# Altium project BB-18 Control Board.PrjPcb (part 1 of 2)
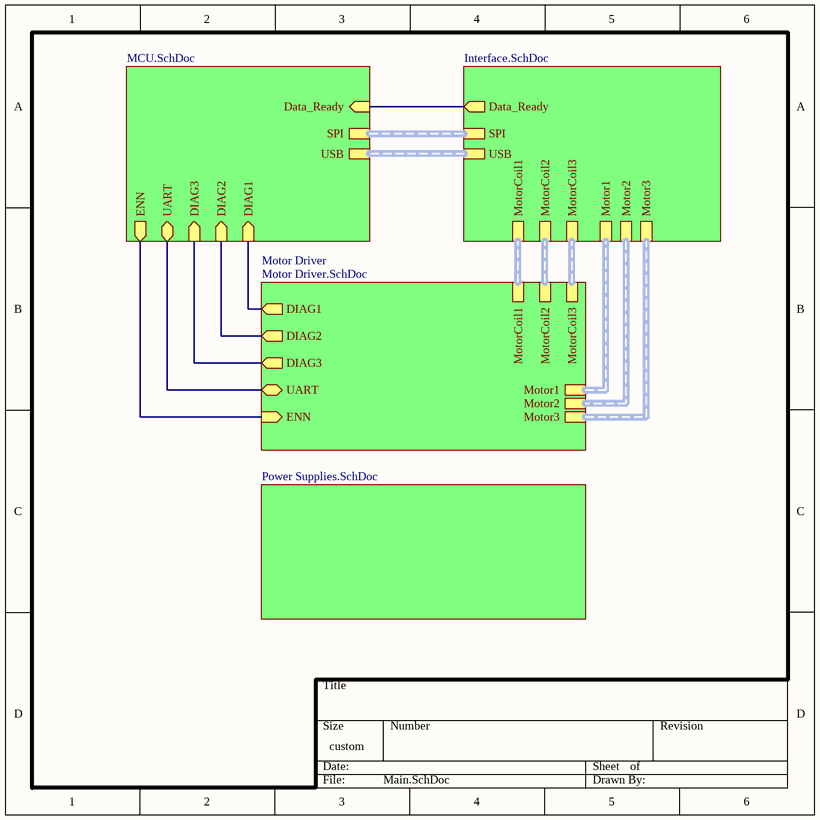
[diagram p0: Main.SchDoc]
5 sheets, 90 parts. Net scope: hierarchical (ports join the sheet entries above them; power ports are global).
Board file: BB-18 Control Board.PcbDoc
Sheets:
  Main.SchDoc
    MCU = MCU.SchDoc
    Interface = Interface.SchDoc
    Motor Driver = Motor Driver.SchDoc
    Power Supplies = Power Supplies.SchDoc

## Sheet Main.SchDoc
size 152 x 152 mm; SheetNumber: 1; SheetTotal: 5

### Sub-sheets
Interface = Interface.SchDoc: SPI (harness SPI), Data_Ready (out), MotorCoil3 (harness Motor3), MotorCoil2 (harness Motor2), MotorCoil1 (harness Motor1), Motor1 (harness Motor1), Motor2 (harness Motor2), Motor3 (harness Motor3), USB (harness USB)
MCU = MCU.SchDoc: SPI (harness SPI), Data_Ready (in), DIAG1 (in), DIAG2 (in), DIAG3 (in), UART (bidir), ENN (out), USB (harness USB)
Motor Driver = Motor Driver.SchDoc: MotorCoil3 (harness Motor3), MotorCoil2 (harness Motor2), MotorCoil1 (harness Motor1), Motor1 (harness Motor1), Motor2 (harness Motor2), Motor3 (harness Motor3), DIAG1 (out), DIAG2 (out), DIAG3 (out), UART (bidir), ENN (in)
Power Supplies = Power Supplies.SchDoc: no entries

### Nets
Data_Ready: sheet MCU/Data_Ready, sheet Interface/Data_Ready
DIAG1: sheet MCU/DIAG1, sheet Motor Driver/DIAG1
DIAG2: sheet MCU/DIAG2, sheet Motor Driver/DIAG2
DIAG3: sheet MCU/DIAG3, sheet Motor Driver/DIAG3
ENN: sheet MCU/ENN, sheet Motor Driver/ENN
UART: sheet MCU/UART, sheet Motor Driver/UART

### Buses and harness runs
harness sheet Interface/Motor1 = sheet Motor Driver/Motor1
harness sheet Interface/Motor2 = sheet Motor Driver/Motor2
harness sheet Interface/Motor3 = sheet Motor Driver/Motor3
harness sheet Interface/MotorCoil1 = sheet Motor Driver/MotorCoil1
harness sheet Interface/MotorCoil2 = sheet Motor Driver/MotorCoil2
harness sheet Interface/MotorCoil3 = sheet Motor Driver/MotorCoil3
harness sheet Interface/SPI = sheet MCU/SPI
harness sheet Interface/USB = sheet MCU/USB

## Sheet MCU.SchDoc
size A; SheetNumber: 2; SheetTotal: 5
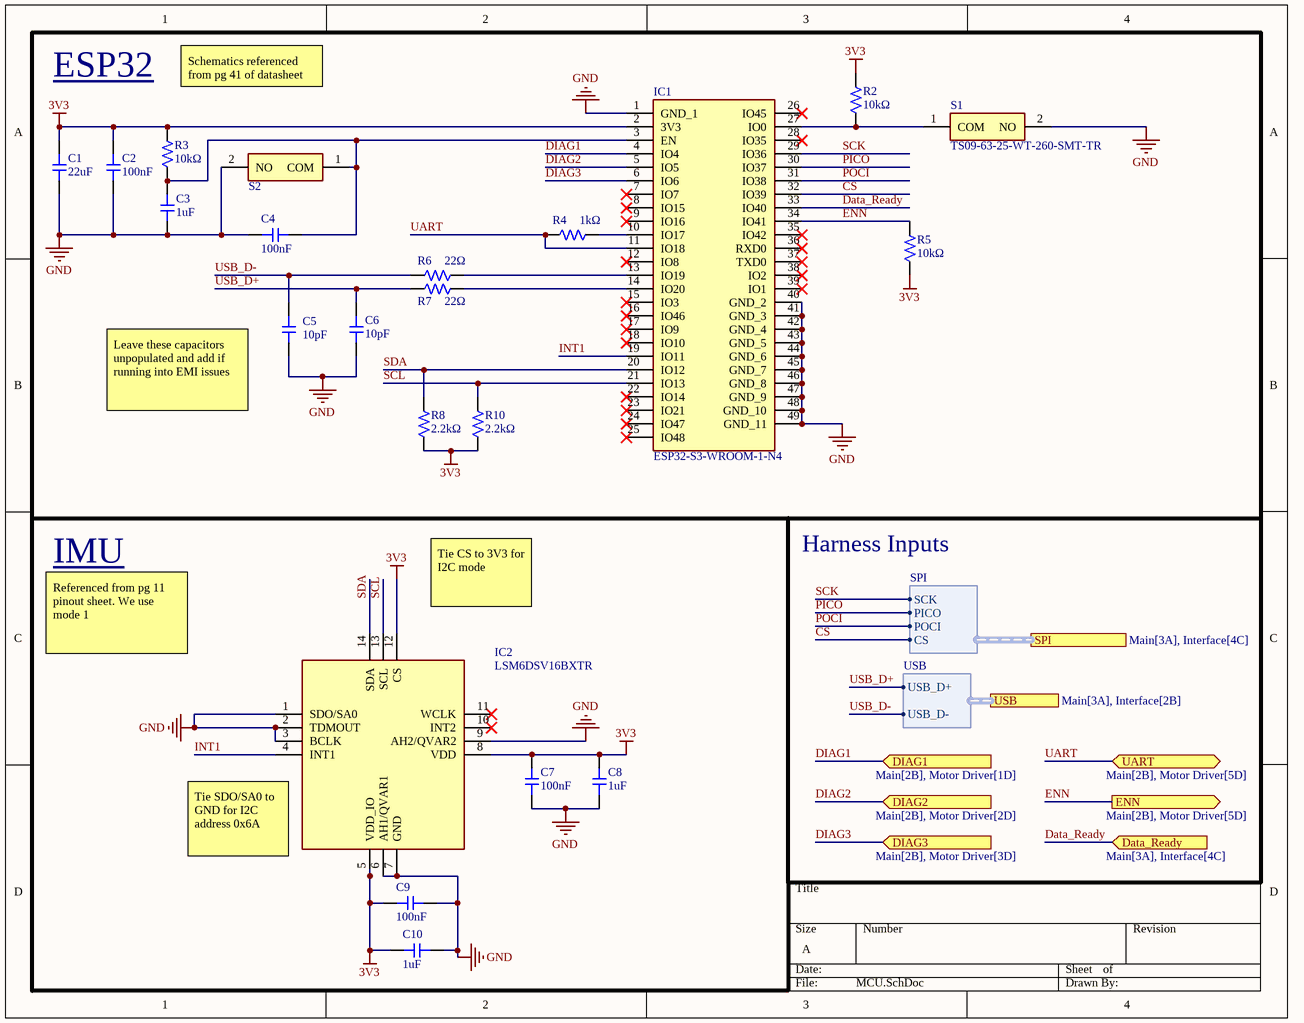
[diagram p1: MCU.SchDoc]

### Parts
C1  Capacitance: 22uF  [CAP-0805]  (hidden comment: CL21A226MAQNNNE)
C2  Capacitance: 100nF  [CAP-0603]  (hidden comment: CC0603KRX7R9BB104)
C3  Capacitance: 1uF  [CAP-0603]  (hidden comment: CL10A105KB8NNNC)
C4  Capacitance: 100nF  [CAP-0603]  (hidden comment: CC0603KRX7R9BB104)
C5  Capacitance: 10pF  [CAP-0603]  (hidden comment: CL10C100JB8NNNC)
C6  Capacitance: 10pF  [CAP-0603]  (hidden comment: CL10C100JB8NNNC)
C7  Capacitance: 100nF  [CAP-0603]  (hidden comment: CC0603KRX7R9BB104)
C8  Capacitance: 1uF  [CAP-0603]  (hidden comment: CL10A105KB8NNNC)
C9  Capacitance: 100nF  [CAP-0603]  (hidden comment: CC0603KRX7R9BB104)
C10  Capacitance: 1uF  [CAP-0603]  (hidden comment: CL10A105KB8NNNC)
IC1  ESP32-S3-WROOM-1-N4  [ESP32S3WROOM1N4]
IC2  LSM6DSV16BXTR  [LSM6DSV16BXTR]
R2  Resistance: 10kΩ  [RES-0603]  (hidden comment: 0603WAF1002T5E)
R3  Resistance: 10kΩ  [RES-0603]  (hidden comment: 0603WAF1002T5E)
R4  Resistance: 1kΩ  [RES-0603]  (hidden comment: 0603WAF1001T5E)
R5  Resistance: 10kΩ  [RES-0603]  (hidden comment: 0603WAF1002T5E)
R6  Resistance: 22Ω  [RES-0603]  (hidden comment: 0603WAF220JT5E)
R7  Resistance: 22Ω  [RES-0603]  (hidden comment: 0603WAF220JT5E)
R8  Resistance: 2.2kΩ  [RES-0603]  (hidden comment: 0603WAF2201T5E)
R10  Resistance: 2.2kΩ  [RES-0603]  (hidden comment: 0603WAF2201T5E)
S1  TS09-63-25-WT-260-SMT-TR  [TS096325WT260SMTTR]
S2  TS09-63-25-WT-260-SMT-TR  [TS096325WT260SMTTR]  (value not drawn)

### Ports
Data_Ready (in, see Main[3A], Interface[4C]), DIAG1 (in, see Main[2B], Motor Driver[1D]), DIAG2 (in, see Main[2B], Motor Driver[2D]), DIAG3 (in, see Main[2B], Motor Driver[3D]), ENN (out, see Main[2B], Motor Driver[5D]), SPI (harness SPI, see Main[3A], Interface[4C]), UART (bidir, see Main[2B], Motor Driver[5D]), USB (harness USB, see Main[3A], Interface[2B])

### Harnesses
SPI: SCK, PICO, POCI, CS
USB: USB_D+, USB_D-

### Nets
3V3: C1.2 C2.2 C7.2 C8.2 C9.1 C10.1 IC1.2(3V3) IC2.5(VDD_IO) IC2.8(VDD) IC2.12(CS) R2.2 R3.2 R5.1 R8.1 R10.1
GND: C1.1 C2.1 C3.1 C4.1 C5.1 C6.1 C7.1 C8.1 C9.2 C10.2 IC1.1(GND_1) IC1.40(GND_2) IC1.41(GND_3) IC1.42(GND_4) IC1.43(GND_5) IC1.44(GND_6) IC1.45(GND_7) IC1.46(GND_8) IC1.47(GND_9) IC1.48(GND_10) IC1.49(GND_11) IC2.1(SDO/SA0) IC2.2(TDMOUT) IC2.3(BCLK) IC2.6(AH1/QVAR1) IC2.7(GND) IC2.9(AH2/QVAR2) S1.2(NO) S2.2(NO)
CS: IC1.32(IO39) ; port SPI.CS
Data_Ready: IC1.33(IO40) ; port Data_Ready
DIAG1: IC1.4(IO4) ; port DIAG1
DIAG2: IC1.5(IO5) ; port DIAG2
DIAG3: IC1.6(IO6) ; port DIAG3
ENN: IC1.34(IO41) R5.2 ; port ENN
INT1: IC1.19(IO11) IC2.4(INT1)
PICO: IC1.30(IO37) ; port SPI.PICO
POCI: IC1.31(IO38) ; port SPI.POCI
SCK: IC1.29(IO36) ; port SPI.SCK
SCL: IC1.21(IO13) IC2.13(SCL) R10.2
SDA: IC1.20(IO12) IC2.14(SDA) R8.2
UART: IC1.11(IO18) R4.1 ; port UART
USB_D+: C6.2 R7.1 ; port USB.USB_D+
USB_D-: C5.2 R6.1 ; port USB.USB_D-
NetC3_2: C3.2 C4.2 IC1.3(EN) R3.1 S2.1(COM)
NetIC1_10: IC1.10(IO17) R4.2
NetIC1_13: IC1.13(IO19) R6.2
NetIC1_14: IC1.14(IO20) R7.2
NetIC1_27: IC1.27(IO0) R2.1 S1.1(COM)

Not connected (* = marked no-connect by the designer): IC1 7(IO7)* 8(IO15)* 9(IO16)* 12(IO8)* 15(IO3)* 16(IO46)* 17(IO9)* 18(IO10)* 22(IO14)* 23(IO21)* 24(IO47)* 25(IO48)* 26(IO45)* 28(IO35)* 35(IO42)* 36(RXD0)* 37(TXD0)* 38(IO2)* 39(IO1)*; IC2 10(INT2)* 11(WCLK)*

### Notes on the sheet
- ESP32 <https://documentation.espressif.com/esp32-s3-wroom-1_wroom-1u_datasheet_en.pdf>
- Schematics referenced from pg 41 of datasheet
- (near C5) Leave these capacitors unpopulated and add if running into EMI issues
- IMU <https://www.st.com/content/ccc/resource/technical/document/datasheet/group3/fe/cf/21/3f/ed/a7/43/1c/DM00803257/files/DM00803257.pdf/jcr:content/translations/en.DM00803257.pdf>
- Harness Inputs
- Tie CS to 3V3 for I2C mode
- Referenced from pg 11 pinout sheet. We use mode 1
- (near IC2) Tie SDO/SA0 to GND for I2C address 0x6A

### Library data of the parts
C1 = CL21A226MAQNNNE: Capacitor, Ceramic (MLCC), 22uF, ±20%, 25V, X5R, ±20%, SMD 0805; Manufacturer: Samsung Electro-Mechanics; Temperature Rating: -55°C ~ 85°C; Capacitance @ 1V DC Bias: 19.999uF; Capacitance @ 1.2V DC Bias: 19.563uF; Capacitance @ 1.35V DC Bias: 19.202uF; Capacitance @ 1.5V DC Bias: 18.822uF; Capacitance @ 1.8V DC Bias: 18.030uF; Capacitance @ 2.5V DC Bias: 16.029uF; Capacitance @ 3.3V DC Bias: 13.689uF; Capacitance @ 3.7V DC Bias: 12.636uF; Capacitance @ 4.2V DC Bias: 11.463uF; Capacitance @ 5V DC Bias: 9.846uF; Capacitance @ 9V DC Bias: 5.133uF; Capacitance @ 12V DC Bias: 3.756uF; Capacitance @ 15V DC Bias: 2.756uF; Capacitance @ 24V DC Bias: 1.578uF; Impedance (0V Bias) @ 100Hz: 93.6Ω; Impedance (0V Bias) @ 500Hz: 19.1Ω; Impedance (0V Bias) @ 1kHz: 9.64Ω; Impedance (0V Bias) @ 5kHz: 1.97Ω; Impedance (0V Bias) @ 10kHz: 0.992Ω; Impedance (0V Bias) @ 50kHz: 0.203Ω; Impedance (0V Bias) @ 100kHz: 0.102Ω; Impedance (0V Bias) @ 500kHz: 0.0188Ω; Impedance (0V Bias) @ 1MHz: 0.00657Ω; Impedance (0V Bias) @ 5MHz: 0.0137Ω; Impedance (0V Bias) @ 10MHz: 0.0227Ω; Impedance (0V Bias) @ 50MHz: 0.0786Ω; Impedance (0V Bias) @ 100MHz: 0.138Ω; Impedance (0V Bias) @ 500MHz: 0.487Ω; Impedance (0V Bias) @ 1GHz: 0.811Ω; Impedance (0V Bias) @ 2GHz: 1.87Ω; Impedance (0V Bias) @ 5GHz: 2.42Ω; Impedance (25V Bias) @ 100Hz: 1.09E+03Ω; Impedance (25V Bias) @ 500Hz: 219Ω; Impedance (25V Bias) @ 1kHz: 110Ω; Impedance (25V Bias) @ 5kHz: 22.1Ω; Impedance (25V Bias) @ 10kHz: 11Ω; Impedance (25V Bias) @ 50kHz: 2.22Ω; Impedance (25V Bias) @ 100kHz: 1.11Ω; Impedance (25V Bias) @ 500kHz: 0.22Ω; Impedance (25V Bias) @ 1MHz: 0.101Ω; Impedance (25V Bias) @ 5MHz: 0.008Ω; Impedance (25V Bias) @ 10MHz: 0.0343Ω; Impedance (25V Bias) @ 50MHz: 0.0782Ω; Impedance (25V Bias) @ 100MHz: 0.136Ω; Impedance (25V Bias) @ 500MHz: 0.528Ω; Impedance (25V Bias) @ 1GHz: 0.864Ω; Impedance (25V Bias) @ 2GHz: 1.78Ω; Impedance (25V Bias) @ 5GHz: 2.43Ω; Package Size: 0805; JLCPCB Basic Part: Yes; JLCPCB Part Number: C45783; Supplier 1: LCSC; Category: Capacitors - MLCC; Supplier Part Number 1: C45783; Manufacturer Part Number: CL21A226MAQNNNE; Tolerance: ±20%; Voltage Rating: 25V; Temperature Coefficient: X5R; RoHS: Yes; ComponentLink1Description: Datasheet; ComponentLink1URL: https://wmsc.lcsc.com/wmsc/upload/file/pdf/v2/lcsc/2304140030_Samsung-Electro-Mechanics-CL21A226MAQNNNE_C45783.pdf; ComponentLink2Description: JLCPCB Part URL; ComponentLink2URL: https://jlcpcb.com/partdetail/C45783; ComponentLink3Description: LCSC Part URL; ComponentLink3URL: https://lcsc.com/product-detail/Multilayer-Ceramic-Capacitors-MLCC---SMD-SMT_Samsung-Electro-Mechanics-Samsung-Electro-Mechanics-CL21A226MAQNNNE_C45783.html; ComponentLink4Description: Samsung Component Library; ComponentLink4URL: https://weblib.samsungsem.com/mlcc/mlcc-ec.do?partNumber=CL21A226MAQNNN
C2 C4 C7 C9 = CC0603KRX7R9BB104: Capacitor, Ceramic (MLCC), 100nF, ±10%, 50V, X7R, ±10%, SMD 0603; Manufacturer: YAGEO; Package Size: 0603; JLCPCB Basic Part: Yes; JLCPCB Part Number: C14663; Supplier 1: LCSC; Category: Capacitors - MLCC; Supplier Part Number 1: C14663; Manufacturer Part Number: CC0603KRX7R9BB104; Tolerance: ±10%; Voltage Rating: 50V; Temperature Coefficient: X7R; RoHS: Yes; ComponentLink1Description: Datasheet; ComponentLink1URL: https://wmsc.lcsc.com/wmsc/upload/file/pdf/v2/lcsc/2211101700_YAGEO-CC0603KRX7R9BB104_C14663.pdf; ComponentLink2Description: JLCPCB Part URL; ComponentLink2URL: https://jlcpcb.com/partdetail/C14663; ComponentLink3Description: LCSC Part URL; ComponentLink3URL: https://lcsc.com/product-detail/Multilayer-Ceramic-Capacitors-MLCC---SMD-SMT_YAGEO-YAGEO-CC0603KRX7R9BB104_C14663.html
C3 C8 C10 = CL10A105KB8NNNC: Capacitor, Ceramic (MLCC), 1uF, ±10%, 50V, X5R, ±10%, SMD 0603; Manufacturer: Samsung Electro-Mechanics; Temperature Rating: -55°C ~ 85°C; Capacitance @ 1V DC Bias: 1.054uF; Capacitance @ 1.2V DC Bias: 1.044uF; Capacitance @ 1.35V DC Bias: 1.035uF; Capacitance @ 1.5V DC Bias: 1.027uF; Capacitance @ 1.8V DC Bias: 1.007uF; Capacitance @ 2.5V DC Bias: 0.947uF; Capacitance @ 3.3V DC Bias: 0.865uF; Capacitance @ 3.7V DC Bias: 0.824uF; Capacitance @ 4.2V DC Bias: 0.773uF; Capacitance @ 5V DC Bias: 0.695uF; Capacitance @ 9V DC Bias: 0.410uF; Capacitance @ 12V DC Bias: 0.308uF; Capacitance @ 15V DC Bias: 0.231uF; Capacitance @ 24V DC Bias: 0.130uF; Capacitance @ 36V DC Bias: 0.080uF; Capacitance @ 48V DC Bias: 0.063uF; Impedance (0V Bias) @ 100Hz: 1.84E+03Ω; Impedance (0V Bias) @ 500Hz: 378Ω; Impedance (0V Bias) @ 1kHz: 191Ω; Impedance (0V Bias) @ 5kHz: 39.1Ω; Impedance (0V Bias) @ 10kHz: 19.8Ω; Impedance (0V Bias) @ 50kHz: 4.04Ω; Impedance (0V Bias) @ 100kHz: 2.04Ω; Impedance (0V Bias) @ 500kHz: 0.416Ω; Impedance (0V Bias) @ 1MHz: 0.208Ω; Impedance (0V Bias) @ 5MHz: 0.0293Ω; Impedance (0V Bias) @ 10MHz: 0.0159Ω; Impedance (0V Bias) @ 50MHz: 0.0822Ω; Impedance (0V Bias) @ 100MHz: 0.14Ω; Impedance (0V Bias) @ 500MHz: 0.54Ω; Impedance (0V Bias) @ 1GHz: 0.988Ω; Impedance (0V Bias) @ 2GHz: 2.38Ω; Impedance (0V Bias) @ 5GHz: 4.94Ω; Package Size: 0603; JLCPCB Basic Part: Yes; JLCPCB Part Number: C15849; Supplier 1: LCSC; Category: Capacitors - MLCC; Supplier Part Number 1: C15849; Manufacturer Part Number: CL10A105KB8NNNC; Tolerance: ±10%; Voltage Rating: 50V; Temperature Coefficient: X5R; RoHS: Yes; ComponentLink1Description: Datasheet; ComponentLink1URL: https://wmsc.lcsc.com/wmsc/upload/file/pdf/v2/lcsc/2304140030_Samsung-Electro-Mechanics-CL10A105KB8NNNC_C15849.pdf; ComponentLink2Description: JLCPCB Part URL; ComponentLink2URL: https://jlcpcb.com/partdetail/C15849; ComponentLink3Description: LCSC Part URL; ComponentLink3URL: https://lcsc.com/product-detail/Multilayer-Ceramic-Capacitors-MLCC---SMD-SMT_Samsung-Electro-Mechanics-Samsung-Electro-Mechanics-CL10A105KB8NNNC_C15849.html; ComponentLink4Description: Samsung Component Library; ComponentLink4URL: https://weblib.samsungsem.com/mlcc/mlcc-ec.do?partNumber=CL10A105KB8NNN
C5 C6 = CL10C100JB8NNNC: Capacitor, Ceramic (MLCC), 10pF, ±5%, 50V, C0G, ±5%, SMD 0603; Manufacturer: Samsung Electro-Mechanics; Temperature Rating: -55°C ~ 125°C; Impedance (0V Bias) @ 100MHz: 159Ω; Impedance (0V Bias) @ 500MHz: 30.3Ω; Impedance (0V Bias) @ 1GHz: 12.8Ω; Impedance (0V Bias) @ 2GHz: 1.36Ω; Impedance (0V Bias) @ 5GHz: 12.1Ω; Package Size: 0603; JLCPCB Basic Part: Yes; JLCPCB Part Number: C1634; Supplier 1: LCSC; Category: Capacitors - MLCC; Supplier Part Number 1: C1634; Manufacturer Part Number: CL10C100JB8NNNC; Tolerance: ±5%; Voltage Rating: 50V; Temperature Coefficient: C0G; RoHS: Yes; ComponentLink1Description: Datasheet; ComponentLink1URL: https://wmsc.lcsc.com/wmsc/upload/file/pdf/v2/lcsc/2304140030_Samsung-Electro-Mechanics-CL10C100JB8NNNC_C1634.pdf; ComponentLink2Description: JLCPCB Part URL; ComponentLink2URL: https://jlcpcb.com/partdetail/C1634; ComponentLink3Description: LCSC Part URL; ComponentLink3URL: https://lcsc.com/product-detail/Multilayer-Ceramic-Capacitors-MLCC---SMD-SMT_Samsung-Electro-Mechanics-Samsung-Electro-Mechanics-CL10C100JB8NNNC_C1634.html; ComponentLink4Description: Samsung Component Library; ComponentLink4URL: https://weblib.samsungsem.com/mlcc/mlcc-ec.do?partNumber=CL10C100JB8NNN
IC1 = ESP32-S3-WROOM-1-N4: Integrated Circuit; Manufacturer_Name: Espressif Systems; Datasheet Link: https://www.espressif.com/sites/default/files/documentation/esp32-s3-wroom-1_wroom-1u_datasheet_en.pdf; Height: 3.25mm; Manufacturer_Part_Number: ESP32-S3-WROOM-1-N4; Mouser Part Number: 356-ESP32-S3WROOM1N4; Mouser Price/Stock: https://www.mouser.co.uk/ProductDetail/Espressif-Systems/ESP32-S3-WROOM-1-N4?qs=Li%252BoUPsLEnsO%2FkiJOUK0FQ%3D%3D
IC2 = LSM6DSV16BXTR: Integrated Circuit; Manufacturer_Name: STMicroelectronics; Datasheet Link: https://www.st.com/resource/en/datasheet/lsm6dsv16bx.pdf; Height: 0.74mm; Manufacturer_Part_Number: LSM6DSV16BXTR; Mouser Part Number: 511-LSM6DSV16BXTR; Mouser Price/Stock: https://www.mouser.co.uk/ProductDetail/STMicroelectronics/LSM6DSV16BXTR?qs=vvQtp7zwQdMXKB4RqH7GHQ%3D%3D; Arrow Part Number: LSM6DSV16BXTR; Arrow Price/Stock: https://www.arrow.com/en/products/lsm6dsv16bxtr/stmicroelectronics?utm_currency=USD&region=nac
R2 R3 R5 = 0603WAF1002T5E: Resistor, 10kΩ, ±1%, 100mW, 75V, ±100ppm/℃, -55℃~+155℃, SMD 0603; Manufacturer: Uniroyal; Supplier 1: LCSC; Manufacturer Part Number: 0603WAF1002T5E; Supplier Part Number 1: C25804; JLCPCB Part Number: C25804; Power Rating: 100mW; Category: Resistors; Package Size: 0603; JLCPCB Basic Part: Yes; Tolerance: ±1%; Voltage Rating: 75V; Temperature Coefficient: ±100ppm/℃; Temperature Rating: -55℃~+155℃; ComponentLink1Description: Datasheet; ComponentLink1URL: https://wmsc.lcsc.com/wmsc/upload/file/pdf/v2/lcsc/2206010045_UNI-ROYAL-Uniroyal-Elec-0603WAF1002T5E_C25804.pdf; ComponentLink2Description: JLCPCB Part URL; ComponentLink2URL: https://jlcpcb.com/partdetail/C25804
R4 = 0603WAF1001T5E: Resistor, 1kΩ, ±1%, 100mW, 75V, ±100ppm/℃, -55℃~+155℃, SMD 0603; Manufacturer: Uniroyal; Supplier 1: LCSC; Manufacturer Part Number: 0603WAF1001T5E; Supplier Part Number 1: C21190; JLCPCB Part Number: C21190; Power Rating: 100mW; Category: Resistors; Package Size: 0603; JLCPCB Basic Part: Yes; Tolerance: ±1%; Voltage Rating: 75V; Temperature Coefficient: ±100ppm/℃; Temperature Rating: -55℃~+155℃; ComponentLink1Description: Datasheet; ComponentLink1URL: https://wmsc.lcsc.com/wmsc/upload/file/pdf/v2/lcsc/2206010130_UNI-ROYAL-Uniroyal-Elec-0603WAF1001T5E_C21190.pdf; ComponentLink2Description: JLCPCB Part URL; ComponentLink2URL: https://jlcpcb.com/partdetail/C21190
R6 R7 = 0603WAF220JT5E: Resistor, 22Ω, ±1%, 100mW, 75V, ±100ppm/℃, -55℃~+155℃, SMD 0603; Manufacturer: Uniroyal; Supplier 1: LCSC; Manufacturer Part Number: 0603WAF220JT5E; Supplier Part Number 1: C23345; JLCPCB Part Number: C23345; Power Rating: 100mW; Category: Resistors; Package Size: 0603; JLCPCB Basic Part: Yes; Tolerance: ±1%; Voltage Rating: 75V; Temperature Coefficient: ±100ppm/℃; Temperature Rating: -55℃~+155℃; ComponentLink1Description: Datasheet; ComponentLink1URL: https://wmsc.lcsc.com/wmsc/upload/file/pdf/v2/lcsc/2206010100_UNI-ROYAL-Uniroyal-Elec-0603WAF220JT5E_C23345.pdf; ComponentLink2Description: JLCPCB Part URL; ComponentLink2URL: https://jlcpcb.com/partdetail/C23345
R8 R10 = 0603WAF2201T5E: Resistor, 2.2kΩ, ±1%, 100mW, 75V, ±100ppm/℃, -55℃~+155℃, SMD 0603; Manufacturer: Uniroyal; Supplier 1: LCSC; Manufacturer Part Number: 0603WAF2201T5E; Supplier Part Number 1: C4190; JLCPCB Part Number: C4190; Power Rating: 100mW; Category: Resistors; Package Size: 0603; JLCPCB Basic Part: Yes; Tolerance: ±1%; Voltage Rating: 75V; Temperature Coefficient: ±100ppm/℃; Temperature Rating: -55℃~+155℃; ComponentLink1Description: Datasheet; ComponentLink1URL: https://wmsc.lcsc.com/wmsc/upload/file/pdf/v2/lcsc/2206010230_UNI-ROYAL-Uniroyal-Elec-0603WAF2201T5E_C4190.pdf; ComponentLink2Description: JLCPCB Part URL; ComponentLink2URL: https://jlcpcb.com/partdetail/C4190
S1 = TS09-63-25-WT-260-SMT-TR: Switch; Manufacturer_Name: Same Sky; Datasheet Link: https://www.sameskydevices.com/product/resource/ts09.pdf; Height: 2.7mm; Manufacturer_Part_Number: TS09-63-25-WT-260-SMT-TR; Mouser Part Number: 179-TS0925WT260SMTTR; Mouser Price/Stock: https://www.mouser.co.uk/ProductDetail/Same-Sky/TS09-63-25-WT-260-SMT-TR?qs=Rp5uXu7WBW9IcFK5UTCCFQ%3D%3D; Arrow Part Number: TS09-63-25-WT-260-SMT-TR; Arrow Price/Stock: https://www.arrow.com/en/products/ts09-63-25-wt-260-smt-tr/cui-devices?utm_currency=USD&region=nac
S2 = TS09-63-25-WT-260-SMT-TR: Manufacturer_Name: Same Sky; Datasheet Link: https://www.sameskydevices.com/product/resource/ts09.pdf; Height: 2.7mm; Manufacturer_Part_Number: TS09-63-25-WT-260-SMT-TR; Mouser Part Number: 179-TS0925WT260SMTTR; Mouser Price/Stock: https://www.mouser.co.uk/ProductDetail/Same-Sky/TS09-63-25-WT-260-SMT-TR?qs=Rp5uXu7WBW9IcFK5UTCCFQ%3D%3D; Arrow Part Number: TS09-63-25-WT-260-SMT-TR; Arrow Price/Stock: https://www.arrow.com/en/products/ts09-63-25-wt-260-smt-tr/cui-devices?utm_currency=USD&region=nac

## Sheet Interface.SchDoc
size 228 x 177 mm; SheetNumber: 4; SheetTotal: 5
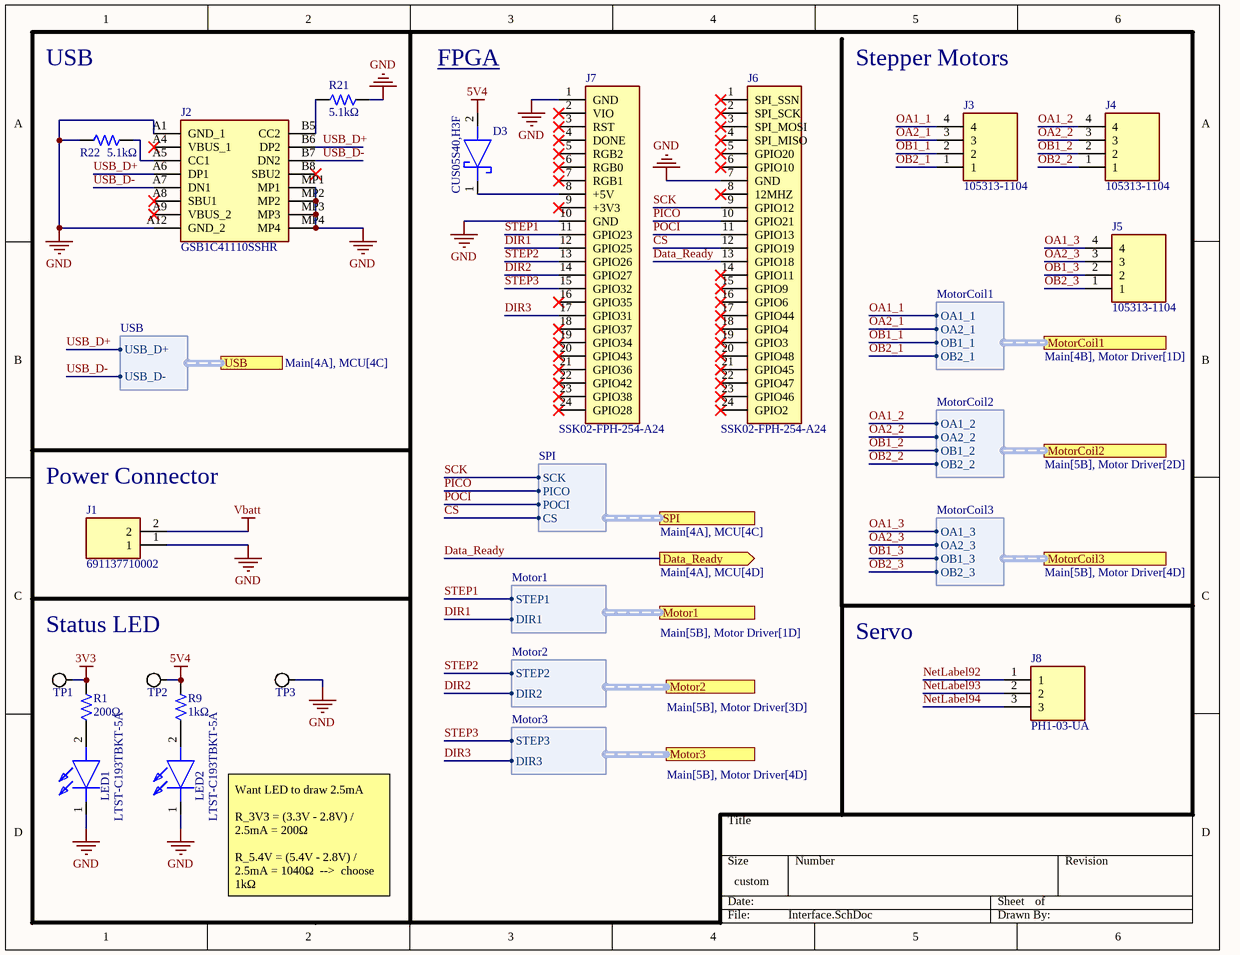
[diagram p2: Interface.SchDoc]

### Parts
D3  CUS05S40,H3F  [CUZ10V]
J1  691137710002  [SHDR2W70P0X500_1X2_1000X750X1150P]
J2  GSB1C41110SSHR  [GSB1C41110SSHR]
J3  105313-1104  [1053131104]
J4  105313-1104  [1053131104]
J5  105313-1104  [1053131104]
J6  SSK02-FPH-254-A24  [RHDR24W69P0X254_1X24_6146X250X870P]
J7  SSK02-FPH-254-A24  [RHDR24W69P0X254_1X24_6146X250X870P]
J8  PH1-03-UA  [HDRV3W64P0X254_1X3_762X250X952P]
LED1  LTST-C193TBKT-5A  [LEDC1608X45N]
LED2  LTST-C193TBKT-5A  [LEDC1608X45N]
R1  Resistance: 200Ω  [RES-0603]  (hidden comment: 0603WAF2000T5E)
R9  Resistance: 1kΩ  [RES-0603]  (hidden comment: 0603WAF1001T5E)
R21  Resistance: 5.1kΩ  [RES-0603]  (hidden comment: 0603WAF5101T5E)
R22  Resistance: 5.1kΩ  [RES-0603]  (hidden comment: 0603WAF5101T5E)
TP1  Test Point Loop  [Test Point Loop - Black]  (value not drawn)
TP2  Test Point Loop  [Test Point Loop - Black]  (value not drawn)
TP3  Test Point Loop  [Test Point Loop - Black]  (value not drawn)

### Ports
Data_Ready (out, see Main[4A], MCU[4D]), Motor1 (harness Motor1, see Main[5B], Motor Driver[1D]), Motor2 (harness Motor2, see Main[5B], Motor Driver[3D]), Motor3 (harness Motor3, see Main[5B], Motor Driver[4D]), MotorCoil1 (harness MotorCoil1, see Main[4B], Motor Driver[1D]), MotorCoil2 (harness MotorCoil2, see Main[5B], Motor Driver[2D]), MotorCoil3 (harness MotorCoil3, see Main[5B], Motor Driver[4D]), SPI (harness SPI, see Main[4A], MCU[4C]), USB (harness USB, see Main[4A], MCU[4C])

### Harnesses
SPI: SCK, PICO, POCI, CS
MotorCoil1: OA1_1, OA2_1, OB1_1, OB2_1
MotorCoil2: OA1_2, OA2_2, OB1_2, OB2_2
MotorCoil3: OA1_3, OA2_3, OB1_3, OB2_3
Motor1: STEP1, DIR1
Motor2: STEP2, DIR2
Motor3: STEP3, DIR3
USB: USB_D+, USB_D-

### Nets
3V3: R1.2 TP1.1
5V4: D3.2(A) R9.2 TP2.1
GND: J1.1 J2.A1(GND_1) J2.A12(GND_2) J2.MP1 J2.MP2 J2.MP3 J2.MP4 J6.7(GND) J7.1(GND) J7.10(GND) LED1.1(K) LED2.1(K) R21.2 R22.1 TP3.1
Vbatt: J1.2
CS: J6.12(GPIO19) ; port SPI.CS
Data_Ready: J6.13(GPIO18) ; port Data_Ready
DIR1: J7.12(GPIO25) ; port Motor1.DIR1
DIR2: J7.14(GPIO27) ; port Motor2.DIR2
DIR3: J7.17(GPIO31) ; port Motor3.DIR3
NetLabel92: J8.1
NetLabel93: J8.2
NetLabel94: J8.3
OA1_1: J3.4 ; port MotorCoil1.OA1_1
OA1_2: J4.4 ; port MotorCoil2.OA1_2
OA1_3: J5.4 ; port MotorCoil3.OA1_3
OA2_1: J3.3 ; port MotorCoil1.OA2_1
OA2_2: J4.3 ; port MotorCoil2.OA2_2
OA2_3: J5.3 ; port MotorCoil3.OA2_3
OB1_1: J3.2 ; port MotorCoil1.OB1_1
OB1_2: J4.2 ; port MotorCoil2.OB1_2
OB1_3: J5.2 ; port MotorCoil3.OB1_3
OB2_1: J3.1 ; port MotorCoil1.OB2_1
OB2_2: J4.1 ; port MotorCoil2.OB2_2
OB2_3: J5.1 ; port MotorCoil3.OB2_3
PICO: J6.10(GPIO21) ; port SPI.PICO
POCI: J6.11(GPIO13) ; port SPI.POCI
SCK: J6.9(GPIO12) ; port SPI.SCK
STEP1: J7.11(GPIO23) ; port Motor1.STEP1
STEP2: J7.13(GPIO26) ; port Motor2.STEP2
STEP3: J7.15(GPIO32) ; port Motor3.STEP3
USB_D+: J2.A6(DP1) J2.B6(DP2) ; port USB.USB_D+
USB_D-: J2.A7(DN1) J2.B7(DN2) ; port USB.USB_D-
NetD3_1: D3.1(K) J7.8(+5V)
NetJ2_A5: J2.A5(CC1) R22.2
NetJ2_B5: J2.B5(CC2) R21.1
NetLED1_2: LED1.2(A) R1.1
NetLED2_2: LED2.2(A) R9.1

Not connected (* = marked no-connect by the designer): J2 A4(VBUS_1)* A8(SBU1)* A9(VBUS_2)* B8(SBU2)*; J6 1(SPI_SSN)* 2(SPI_SCK)* 3(SPI_MOSI)* 4(SPI_MISO)* 5(GPIO20)* 6(GPIO10)* 8(12MHZ)* 14(GPIO11)* 15(GPIO9)* 16(GPIO6)* 17(GPIO44)* 18(GPIO4)* 19(GPIO3)* 20(GPIO48)* 21(GPIO45)* 22(GPIO47)* 23(GPIO46)* 24(GPIO2)*; J7 2(VIO)* 3(RST)* 4(DONE)* 5(RGB2)* 6(RGB0)* 7(RGB1)* 9(+3V3)* 16(GPIO35)* 18(GPIO37)* 19(GPIO34)* 20(GPIO43)* 21(GPIO36)* 22(GPIO42)* 23(GPIO38)* 24(GPIO28)*

### Notes on the sheet
- USB
- FPGA <https://upduino.readthedocs.io/en/latest/introduction/introduction.html>
- Stepper Motors
- (near J1) Power Connector
- Status LED
- Servo
- Want LED to draw 2.5mA
  R_3V3 = (3.3V - 2.8V) / 2.5mA = 200Ω
  R_5.4V = (5.4V - 2.8V) / 2.5mA = 1040Ω  -->  choose 1kΩ

### Library data of the parts
D3 = CUS05S40,H3F: CUS05S40,H3F, Schottky Diode; Manufacturer_Name: Toshiba; Datasheet Link: http://toshiba.semicon-storage.com/info/docget.jsp?did=14743&prodName=CUS05S40; Height: 1.1mm; Manufacturer_Part_Number: CUS05S40,H3F; Mouser Part Number: 757-CUS05S40H3F; Mouser Price/Stock: https://www.mouser.co.uk/ProductDetail/Toshiba/CUS05S40H3F?qs=cW4DzVrAanNdPcmUvyvUwQ%3D%3D; Arrow Part Number: CUS05S40,H3F; Arrow Price/Stock: https://www.arrow.com/en/products/cus05s40h3f/toshiba?utm_currency=USD&region=nac
J1 = 691137710002: Connector; Manufacturer_Name: Wurth Elektronik; Datasheet Link: https://www.we-online.com/catalog/datasheet/691137710002.pdf; Height: 11.5mm; Manufacturer_Part_Number: 691137710002; Mouser Part Number: 710-691137710002; Mouser Price/Stock: https://www.mouser.co.uk/ProductDetail/Wurth-Elektronik/691137710002?qs=lBTPRtX1sU9LnHBbviNKGA%3D%3D
J2 = GSB1C41110SSHR: Connector; Manufacturer_Name: Amphenol Communications Solutions; Datasheet Link: https://cdn.amphenol-cs.com/media/wysiwyg/files/drawing/gsb1c41x10sshr-ax1.pdf; Height: 3.41mm; Manufacturer_Part_Number: GSB1C41110SSHR; Arrow Part Number: GSB1C41110SSHR; Arrow Price/Stock: https://www.arrow.com/en/products/gsb1c41110sshr/amphenol-fci.html?utm_currency=USD&region=asia
J3-J5 = 105313-1104: 4-Pin Right Angle Nanofit; Manufacturer_Name: Molex; Datasheet Link: http://www.molex.com/webdocs/datasheets/pdf/en-us//1053131104_PCB_HEADERS.pdf; Height: 6.84mm; Manufacturer_Part_Number: 105313-1104; Mouser Part Number: 538-105313-1104; Mouser Price/Stock: https://www.mouser.co.uk/ProductDetail/Molex/105313-1104?qs=PqFvFmEiOr4uJzhImSsntA%3D%3D
J6 J7 = SSK02-FPH-254-A24: Connector; Manufacturer_Name: Same Sky; Datasheet Link: https://www.sameskydevices.com/product/resource/ssk02-fph-254.pdf; Height: 8.7mm; Manufacturer_Part_Number: SSK02-FPH-254-A24
J8 = PH1-03-UA: Connector; Manufacturer_Name: Adam Tech; Datasheet Link: https://datasheet.datasheetarchive.com/originals/distributors/Datasheets_SAMA/34c52fbb4019bb4b288b881302863af3.pdf; Height: 9.516mm; Manufacturer_Part_Number: PH1-03-UA; Mouser Part Number: 737-PH1-03-UA; Mouser Price/Stock: https://www.mouser.co.uk/ProductDetail/Adam-Tech/PH1-03-UA?qs=HoCaDK9Nz5cktq3WKneQTQ%3D%3D; Arrow Part Number: PH1-03-UA; Arrow Price/Stock: https://www.arrow.com/en/products/ph1-03-ua/adam-tech?utm_currency=USD&region=europe
R1 = 0603WAF2000T5E: Resistor, 200Ω, ±1%, 100mW, 75V, ±100ppm/℃, -55℃~+155℃, SMD 0603; Manufacturer: Uniroyal; Supplier 1: LCSC; Manufacturer Part Number: 0603WAF2000T5E; Supplier Part Number 1: C8218; JLCPCB Part Number: C8218; Power Rating: 100mW; Category: Resistors; Package Size: 0603; JLCPCB Basic Part: Yes; Tolerance: ±1%; Voltage Rating: 75V; Temperature Coefficient: ±100ppm/℃; Temperature Rating: -55℃~+155℃; ComponentLink1Description: Datasheet; ComponentLink1URL: https://wmsc.lcsc.com/wmsc/upload/file/pdf/v2/lcsc/2206010216_UNI-ROYAL-Uniroyal-Elec-0603WAF2000T5E_C8218.pdf; ComponentLink2Description: JLCPCB Part URL; ComponentLink2URL: https://jlcpcb.com/partdetail/C8218
R9 = 0603WAF1001T5E: as R4 on sheet MCU; Supplier 1: LCSC; Manufacturer Part Number: 0603WAF1001T5E; Supplier Part Number 1: C21190; JLCPCB Part Number: C21190; Power Rating: 100mW; Category: Resistors; Package Size: 0603; JLCPCB Basic Part: Yes; Tolerance: ±1%; Voltage Rating: 75V; Temperature Coefficient: ±100ppm/℃; Temperature Rating: -55℃~+155℃; ComponentLink1Description: Datasheet; ComponentLink1URL: https://wmsc.lcsc.com/wmsc/upload/file/pdf/v2/lcsc/2206010130_UNI-ROYAL-Uniroyal-Elec-0603WAF1001T5E_C21190.pdf; ComponentLink2Description: JLCPCB Part URL; ComponentLink2URL: https://jlcpcb.com/partdetail/C21190
R21 R22 = 0603WAF5101T5E: Resistor, 5.1kΩ, ±1%, 100mW, 75V, ±100ppm/℃, -55℃~+155℃, SMD 0603; Manufacturer: Uniroyal; Supplier 1: LCSC; Manufacturer Part Number: 0603WAF5101T5E; Supplier Part Number 1: C23186; JLCPCB Part Number: C23186; Power Rating: 100mW; Category: Resistors; Package Size: 0603; JLCPCB Basic Part: Yes; Tolerance: ±1%; Voltage Rating: 75V; Temperature Coefficient: ±100ppm/℃; Temperature Rating: -55℃~+155℃; ComponentLink1Description: Datasheet; ComponentLink1URL: https://wmsc.lcsc.com/wmsc/upload/file/pdf/v2/lcsc/2206010116_UNI-ROYAL-Uniroyal-Elec-0603WAF5101T5E_C23186.pdf; ComponentLink2Description: JLCPCB Part URL; ComponentLink2URL: https://jlcpcb.com/partdetail/C23186
TP1-TP3 = Test Point Loop: Keyston Electronics 5001 Test Point Loop; Manufacturer P/N: 5001; Manufacturer: Keystone Electronics; Color: Black; Supplier 1: Digi-Key; Supplier Part Number 1: 36-5001-ND

## Sheet Motor Driver.SchDoc
size 347 x 193 mm; SheetNumber: 5; SheetTotal: 5
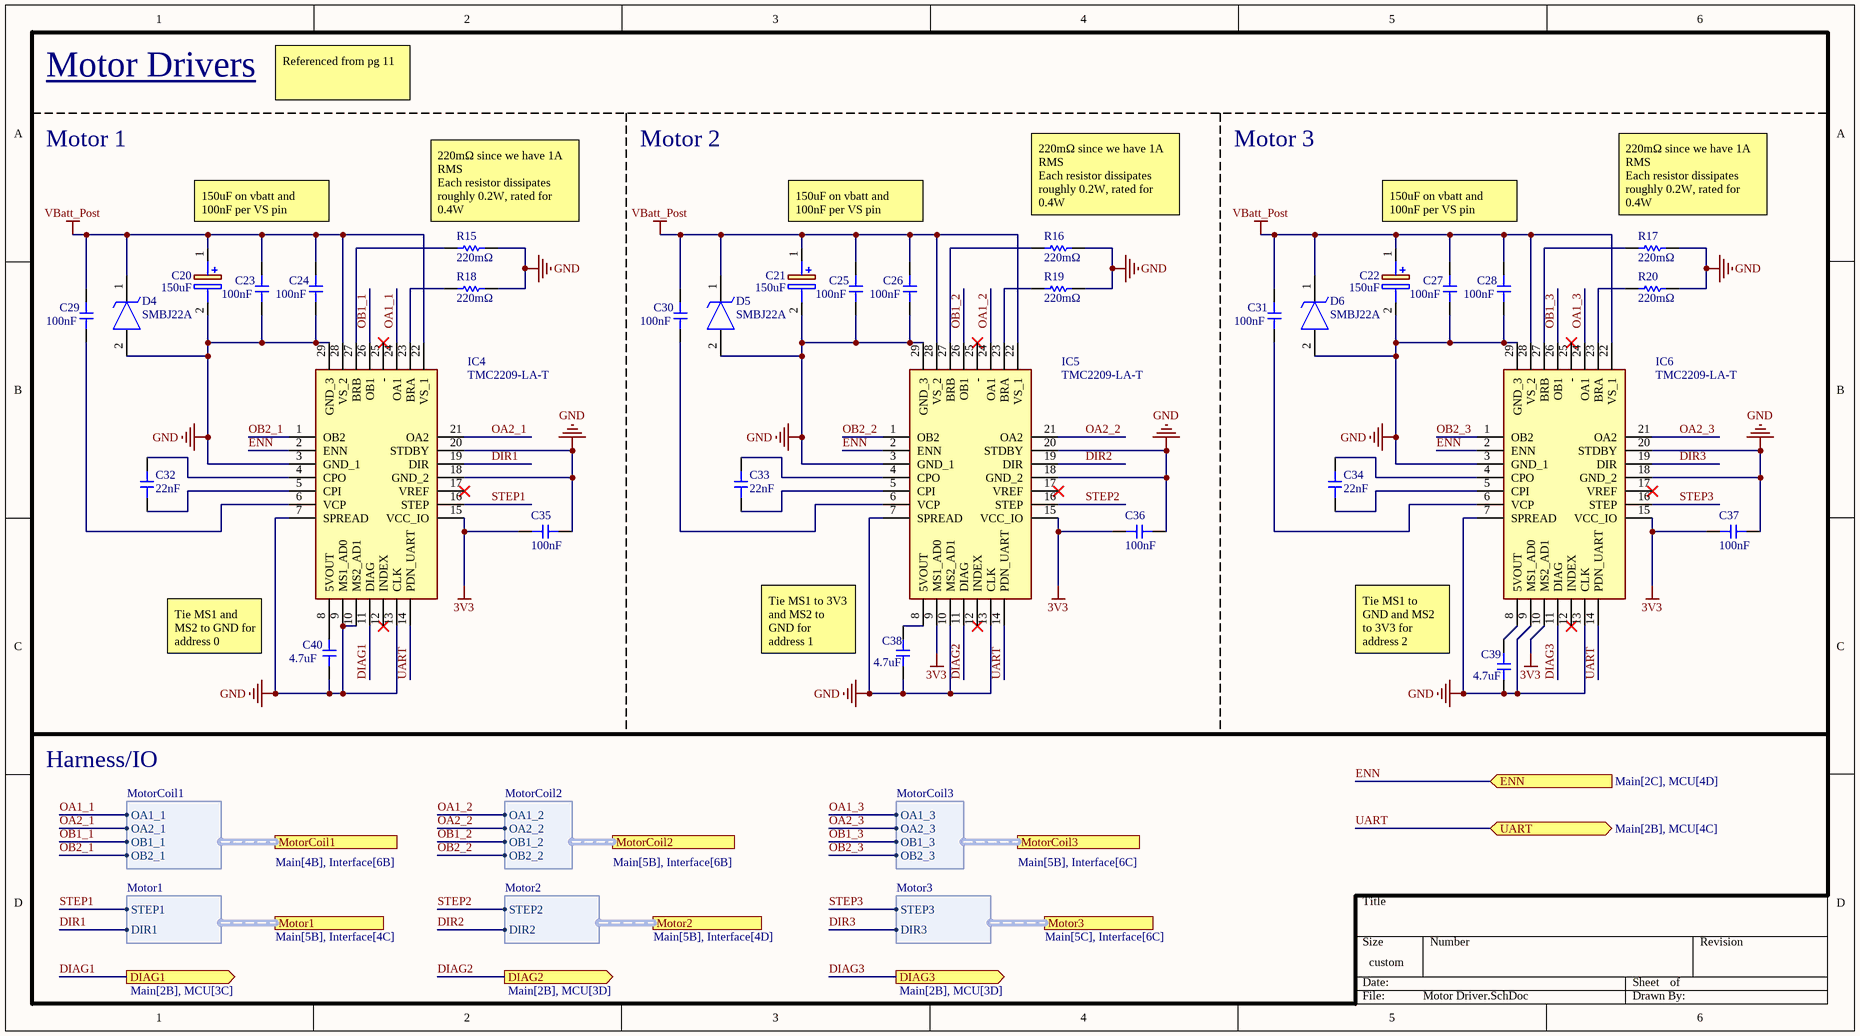
[diagram p3: Motor Driver.SchDoc]

### Parts
C20  150uF  [EEHZA1H680P]
C21  150uF  [EEHZA1H680P]
C22  150uF  [EEHZA1H680P]
C23  Capacitance: 100nF  [CAP-0603]  (hidden comment: CC0603KRX7R9BB104)
C24  Capacitance: 100nF  [CAP-0603]  (hidden comment: CC0603KRX7R9BB104)
C25  Capacitance: 100nF  [CAP-0603]  (hidden comment: CC0603KRX7R9BB104)
C26  Capacitance: 100nF  [CAP-0603]  (hidden comment: CC0603KRX7R9BB104)
C27  Capacitance: 100nF  [CAP-0603]  (hidden comment: CC0603KRX7R9BB104)
C28  Capacitance: 100nF  [CAP-0603]  (hidden comment: CC0603KRX7R9BB104)
C29  Capacitance: 100nF  [CAP-0603]  (hidden comment: CC0603KRX7R9BB104)
C30  Capacitance: 100nF  [CAP-0603]  (hidden comment: CC0603KRX7R9BB104)
C31  Capacitance: 100nF  [CAP-0603]  (hidden comment: CC0603KRX7R9BB104)
C32  Capacitance: 22nF  [CAP-0603]  (hidden comment: CL10B223KB8NNNC)
C33  Capacitance: 22nF  [CAP-0603]  (hidden comment: CL10B223KB8NNNC)
C34  Capacitance: 22nF  [CAP-0603]  (hidden comment: CL10B223KB8NNNC)
C35  Capacitance: 100nF  [CAP-0603]  (hidden comment: CC0603KRX7R9BB104)
C36  Capacitance: 100nF  [CAP-0603]  (hidden comment: CC0603KRX7R9BB104)
C37  Capacitance: 100nF  [CAP-0603]  (hidden comment: CC0603KRX7R9BB104)
C38  Capacitance: 4.7uF  [CAP-0603]  (hidden comment: CL10A475KO8NNNC)
C39  Capacitance: 4.7uF  [CAP-0603]  (hidden comment: CL10A475KO8NNNC)
C40  Capacitance: 4.7uF  [CAP-0603]  (hidden comment: CL10A475KO8NNNC)
D4  SMBJ22A  [SMBJ12A]
D5  SMBJ22A  [SMBJ12A]
D6  SMBJ22A  [SMBJ12A]
IC4  TMC2209-LA-T  [QFN50P500X500X90-29N-D]
IC5  TMC2209-LA-T  [QFN50P500X500X90-29N-D]
IC6  TMC2209-LA-T  [QFN50P500X500X90-29N-D]
R15  220mΩ  [RESC1608X55N]
R16  220mΩ  [RESC1608X55N]
R17  220mΩ  [RESC1608X55N]
R18  220mΩ  [RESC1608X55N]
R19  220mΩ  [RESC1608X55N]
R20  220mΩ  [RESC1608X55N]

### Ports
DIAG1 (out, see Main[2B], MCU[3C]), DIAG2 (out, see Main[2B], MCU[3D]), DIAG3 (out, see Main[2B], MCU[3D]), ENN (in, see Main[2C], MCU[4D]), Motor1 (harness Motor1, see Main[5B], Interface[4C]), Motor2 (harness Motor2, see Main[5B], Interface[4D]), Motor3 (harness Motor3, see Main[5C], Interface[6C]), MotorCoil1 (harness MotorCoil1, see Main[4B], Interface[6B]), MotorCoil2 (harness MotorCoil2, see Main[5B], Interface[6B]), MotorCoil3 (harness MotorCoil3, see Main[5B], Interface[6C]), UART (bidir, see Main[2B], MCU[4C])

### Harnesses
MotorCoil1: OA1_1, OA2_1, OB1_1, OB2_1
MotorCoil2: OA1_2, OA2_2, OB1_2, OB2_2
MotorCoil3: OA1_3, OA2_3, OB1_3, OB2_3
Motor1: STEP1, DIR1
Motor2: STEP2, DIR2
Motor3: STEP3, DIR3

### Nets
3V3: C35.1 C36.1 C37.1 IC4.15(VCC_IO) IC5.9(MS1_AD0) IC5.15(VCC_IO) IC6.10(MS2_AD1) IC6.15(VCC_IO)
GND: C20.2(-) C21.2(-) C22.2(-) C23.1 C24.1 C25.1 C26.1 C27.1 C28.1 C35.2 C36.2 C37.2 C38.1 C39.1 C40.1 D4.2(A) D5.2(A) D6.2(A) IC4.3(GND_1) IC4.7(SPREAD) IC4.9(MS1_AD0) IC4.10(MS2_AD1) IC4.13(CLK) IC4.18(GND_2) IC4.20(STDBY) IC4.29(GND_3) IC5.3(GND_1) IC5.7(SPREAD) IC5.10(MS2_AD1) IC5.13(CLK) IC5.18(GND_2) IC5.20(STDBY) IC5.29(GND_3) IC6.3(GND_1) IC6.7(SPREAD) IC6.9(MS1_AD0) IC6.13(CLK) IC6.18(GND_2) IC6.20(STDBY) IC6.29(GND_3) R15.2 R16.2 R17.2 R18.2 R19.2 R20.2
VBatt_Post: C20.1(+) C21.1(+) C22.1(+) C23.2 C24.2 C25.2 C26.2 C27.2 C28.2 C29.2 C30.2 C31.2 D4.1(K) D5.1(K) D6.1(K) IC4.22(VS_1) IC4.28(VS_2) IC5.22(VS_1) IC5.28(VS_2) IC6.22(VS_1) IC6.28(VS_2)
DIAG1: IC4.11(DIAG) ; port DIAG1
DIAG2: IC5.11(DIAG) ; port DIAG2
DIAG3: IC6.11(DIAG) ; port DIAG3
DIR1: IC4.19(DIR) ; port Motor1.DIR1
DIR2: IC5.19(DIR) ; port Motor2.DIR2
DIR3: IC6.19(DIR) ; port Motor3.DIR3
ENN: IC4.2(ENN) IC5.2(ENN) IC6.2(ENN) ; port ENN
OA1_1: IC4.24(OA1) ; port MotorCoil1.OA1_1
OA1_2: IC5.24(OA1) ; port MotorCoil2.OA1_2
OA1_3: IC6.24(OA1) ; port MotorCoil3.OA1_3
OA2_1: IC4.21(OA2) ; port MotorCoil1.OA2_1
OA2_2: IC5.21(OA2) ; port MotorCoil2.OA2_2
OA2_3: IC6.21(OA2) ; port MotorCoil3.OA2_3
OB1_1: IC4.26(OB1) ; port MotorCoil1.OB1_1
OB1_2: IC5.26(OB1) ; port MotorCoil2.OB1_2
OB1_3: IC6.26(OB1) ; port MotorCoil3.OB1_3
OB2_1: IC4.1(OB2) ; port MotorCoil1.OB2_1
OB2_2: IC5.1(OB2) ; port MotorCoil2.OB2_2
OB2_3: IC6.1(OB2) ; port MotorCoil3.OB2_3
STEP1: IC4.16(STEP) ; port Motor1.STEP1
STEP2: IC5.16(STEP) ; port Motor2.STEP2
STEP3: IC6.16(STEP) ; port Motor3.STEP3
UART: IC4.14(PDN_UART) IC5.14(PDN_UART) IC6.14(PDN_UART) ; port UART
NetC29_1: C29.1 IC4.6(VCP)
NetC30_1: C30.1 IC5.6(VCP)
NetC31_1: C31.1 IC6.6(VCP)
NetC32_1: C32.1 IC4.5(CPI)
NetC32_2: C32.2 IC4.4(CPO)
NetC33_1: C33.1 IC5.5(CPI)
NetC33_2: C33.2 IC5.4(CPO)
NetC34_1: C34.1 IC6.5(CPI)
NetC34_2: C34.2 IC6.4(CPO)
NetC38_2: C38.2 IC5.8(5VOUT)
NetC39_2: C39.2 IC6.8(5VOUT)
NetC40_2: C40.2 IC4.8(5VOUT)
NetIC4_23: IC4.23(BRA) R18.1
NetIC4_27: IC4.27(BRB) R15.1
NetIC5_23: IC5.23(BRA) R19.1
NetIC5_27: IC5.27(BRB) R16.1
NetIC6_23: IC6.23(BRA) R20.1
NetIC6_27: IC6.27(BRB) R17.1

Not connected (* = marked no-connect by the designer): IC4 12(INDEX)* 17(VREF)* 25(-)*; IC5 12(INDEX)* 17(VREF)* 25(-)*; IC6 12(INDEX)* 17(VREF)* 25(-)*

### Notes on the sheet
- Motor Drivers <https://www.analog.com/media/en/technical-documentation/data-sheets/tmc2209_datasheet_rev1.09.pdf>
- Referenced from pg 11
- Motor 1
- Motor 2
- Motor 3
- 150uF on vbatt and 100nF per VS pin
- (near R15) 220mΩ since we have 1A RMS
  Each resistor dissipates roughly 0.2W, rated for 0.4W
- (near R16) 220mΩ since we have 1A RMS
  Each resistor dissipates roughly 0.2W, rated for 0.4W
- (near R17) 220mΩ since we have 1A RMS
  Each resistor dissipates roughly 0.2W, rated for 0.4W
- Tie MS1 and MS2 to GND for address 0
- Tie MS1 to 3V3 and MS2 to GND for address 1
- Tie MS1 to GND and MS2 to 3V3 for address 2
- Harness/IO

### Library data of the parts
C20-C22 = EEH-ZA1V151P: Capacitor Polarised, EEH-ZA1V151P; Manufacturer_Name: Panasonic; Datasheet Link: http://industrial.panasonic.com/cdbs/www-data/pdf/RDD0000/ABA0000C1221.pdf; Height: 10.8mm; Manufacturer_Part_Number: EEH-ZA1V151P; Mouser Part Number: 667-EEH-ZA1V151P; Mouser Price/Stock: https://www.mouser.co.uk/ProductDetail/Panasonic/EEH-ZA1V151P?qs=7UCyOFMWVHbEfsj1CtRV9Q%3D%3D
C23-C31 C35-C37 = CC0603KRX7R9BB104: as C2 on sheet MCU; Package Size: 0603; JLCPCB Basic Part: Yes; JLCPCB Part Number: C14663; Supplier 1: LCSC; Category: Capacitors - MLCC; Supplier Part Number 1: C14663; Manufacturer Part Number: CC0603KRX7R9BB104; Tolerance: ±10%; Voltage Rating: 50V; Temperature Coefficient: X7R; RoHS: Yes; ComponentLink1Description: Datasheet; ComponentLink1URL: https://wmsc.lcsc.com/wmsc/upload/file/pdf/v2/lcsc/2211101700_YAGEO-CC0603KRX7R9BB104_C14663.pdf; ComponentLink2Description: JLCPCB Part URL; ComponentLink2URL: https://jlcpcb.com/partdetail/C14663; ComponentLink3Description: LCSC Part URL; ComponentLink3URL: https://lcsc.com/product-detail/Multilayer-Ceramic-Capacitors-MLCC---SMD-SMT_YAGEO-YAGEO-CC0603KRX7R9BB104_C14663.html
C32-C34 = CL10B223KB8NNNC: Capacitor, Ceramic (MLCC), 22nF, ±10%, 50V, X7R, ±10%, SMD 0603; Manufacturer: Samsung Electro-Mechanics; Temperature Rating: -55°C ~ 125°C; Capacitance @ 1V DC Bias: 22.573nF; Capacitance @ 1.2V DC Bias: 22.636nF; Capacitance @ 1.35V DC Bias: 22.685nF; Capacitance @ 1.5V DC Bias: 22.733nF; Capacitance @ 1.8V DC Bias: 22.823nF; Capacitance @ 2.5V DC Bias: 22.946nF; Capacitance @ 3.3V DC Bias: 23.004nF; Capacitance @ 3.7V DC Bias: 23.013nF; Capacitance @ 4.2V DC Bias: 23.008nF; Capacitance @ 5V DC Bias: 22.974nF; Capacitance @ 9V DC Bias: 22.838nF; Capacitance @ 12V DC Bias: 22.650nF; Capacitance @ 15V DC Bias: 22.427nF; Capacitance @ 24V DC Bias: 21.437nF; Capacitance @ 36V DC Bias: 19.554nF; Capacitance @ 48V DC Bias: 17.020nF; Impedance (0V Bias) @ 100Hz: 7.5E+04Ω; Impedance (0V Bias) @ 500Hz: 1.52E+04Ω; Impedance (0V Bias) @ 1kHz: 7.64E+03Ω; Impedance (0V Bias) @ 5kHz: 1.55E+03Ω; Impedance (0V Bias) @ 10kHz: 779Ω; Impedance (0V Bias) @ 50kHz: 158Ω; Impedance (0V Bias) @ 100kHz: 79.4Ω; Impedance (0V Bias) @ 500kHz: 16.1Ω; Impedance (0V Bias) @ 1MHz: 8.09Ω; Impedance (0V Bias) @ 5MHz: 1.63Ω; Impedance (0V Bias) @ 10MHz: 0.801Ω; Impedance (0V Bias) @ 50MHz: 0.0651Ω; Impedance (0V Bias) @ 100MHz: 0.206Ω; Impedance (0V Bias) @ 500MHz: 0.865Ω; Impedance (0V Bias) @ 1GHz: 1.65Ω; Impedance (0V Bias) @ 2GHz: 4.18Ω; Impedance (0V Bias) @ 5GHz: 9.53Ω; Package Size: 0603; JLCPCB Basic Part: Yes; JLCPCB Part Number: C21122; Supplier 1: LCSC; Category: Capacitors - MLCC; Supplier Part Number 1: C21122; Manufacturer Part Number: CL10B223KB8NNNC; Tolerance: ±10%; Voltage Rating: 50V; Temperature Coefficient: X7R; RoHS: Yes; ComponentLink1Description: Datasheet; ComponentLink1URL: https://wmsc.lcsc.com/wmsc/upload/file/pdf/v2/lcsc/2304140030_Samsung-Electro-Mechanics-CL10B223KB8NNNC_C21122.pdf; ComponentLink2Description: JLCPCB Part URL; ComponentLink2URL: https://jlcpcb.com/partdetail/C21122; ComponentLink3Description: LCSC Part URL; ComponentLink3URL: https://lcsc.com/product-detail/Multilayer-Ceramic-Capacitors-MLCC---SMD-SMT_Samsung-Electro-Mechanics-Samsung-Electro-Mechanics-CL10B223KB8NNNC_C21122.html; ComponentLink4Description: Samsung Component Library; ComponentLink4URL: https://weblib.samsungsem.com/mlcc/mlcc-ec.do?partNumber=CL10B223KB8NNN
C38-C40 = CL10A475KO8NNNC: Capacitor, Ceramic (MLCC), 4.7uF, ±10%, 16V, X5R, ±10%, SMD 0603; Manufacturer: Samsung Electro-Mechanics; Temperature Rating: -55°C ~ 85°C; Capacitance @ 1V DC Bias: 4.097uF; Capacitance @ 1.2V DC Bias: 4.030uF; Capacitance @ 1.35V DC Bias: 3.972uF; Capacitance @ 1.5V DC Bias: 3.908uF; Capacitance @ 1.8V DC Bias: 3.769uF; Capacitance @ 2.5V DC Bias: 3.406uF; Capacitance @ 3.3V DC Bias: 2.969uF; Capacitance @ 3.7V DC Bias: 2.760uF; Capacitance @ 4.2V DC Bias: 2.508uF; Capacitance @ 5V DC Bias: 2.138uF; Capacitance @ 9V DC Bias: 1.155uF; Capacitance @ 12V DC Bias: 0.873uF; Capacitance @ 15V DC Bias: 0.647uF; Impedance (0V Bias) @ 100Hz: 437Ω; Impedance (0V Bias) @ 500Hz: 90.6Ω; Impedance (0V Bias) @ 1kHz: 46Ω; Impedance (0V Bias) @ 5kHz: 9.51Ω; Impedance (0V Bias) @ 10kHz: 4.83Ω; Impedance (0V Bias) @ 50kHz: 0.996Ω; Impedance (0V Bias) @ 100kHz: 0.505Ω; Impedance (0V Bias) @ 500kHz: 0.104Ω; Impedance (0V Bias) @ 1MHz: 0.05Ω; Impedance (0V Bias) @ 5MHz: 0.011Ω; Impedance (0V Bias) @ 10MHz: 0.0248Ω; Impedance (0V Bias) @ 50MHz: 0.0811Ω; Impedance (0V Bias) @ 100MHz: 0.141Ω; Impedance (0V Bias) @ 500MHz: 0.57Ω; Impedance (0V Bias) @ 1GHz: 1.02Ω; Impedance (0V Bias) @ 2GHz: 2.37Ω; Impedance (0V Bias) @ 5GHz: 4.65Ω; Impedance (16V Bias) @ 100Hz: 3.74E+03Ω; Impedance (16V Bias) @ 500Hz: 758Ω; Impedance (16V Bias) @ 1kHz: 381Ω; Impedance (16V Bias) @ 5kHz: 77.1Ω; Impedance (16V Bias) @ 10kHz: 38.7Ω; Impedance (16V Bias) @ 50kHz: 7.82Ω; Impedance (16V Bias) @ 100kHz: 3.93Ω; Impedance (16V Bias) @ 500kHz: 0.79Ω; Impedance (16V Bias) @ 1MHz: 0.386Ω; Impedance (16V Bias) @ 5MHz: 0.077Ω; Impedance (16V Bias) @ 10MHz: 0.0173Ω; Impedance (16V Bias) @ 50MHz: 0.0836Ω; Impedance (16V Bias) @ 100MHz: 0.142Ω; Impedance (16V Bias) @ 500MHz: 0.585Ω; Impedance (16V Bias) @ 1GHz: 1.06Ω; Impedance (16V Bias) @ 2GHz: 2.36Ω; Impedance (16V Bias) @ 5GHz: 4.63Ω; Package Size: 0603; JLCPCB Basic Part: Yes; JLCPCB Part Number: C19666; Supplier 1: LCSC; Category: Capacitors - MLCC; Supplier Part Number 1: C19666; Manufacturer Part Number: CL10A475KO8NNNC; Tolerance: ±10%; Voltage Rating: 16V; Temperature Coefficient: X5R; RoHS: Yes; ComponentLink1Description: Datasheet; ComponentLink1URL: https://wmsc.lcsc.com/wmsc/upload/file/pdf/v2/lcsc/2304140030_Samsung-Electro-Mechanics-CL10A475KO8NNNC_C19666.pdf; ComponentLink2Description: JLCPCB Part URL; ComponentLink2URL: https://jlcpcb.com/partdetail/C19666; ComponentLink3Description: LCSC Part URL; ComponentLink3URL: https://lcsc.com/product-detail/Multilayer-Ceramic-Capacitors-MLCC---SMD-SMT_Samsung-Electro-Mechanics-Samsung-Electro-Mechanics-CL10A475KO8NNNC_C19666.html; ComponentLink4Description: Samsung Component Library; ComponentLink4URL: https://weblib.samsungsem.com/mlcc/mlcc-ec.do?partNumber=CL10A475KO8NNN
D4-D6 = SMBJ22A: TVS Diode (Uni-directional); Manufacturer_Name: STMicroelectronics; Datasheet Link: https://www.st.com/resource/en/datasheet/smbj12a.pdf; Height: 2.45mm; Manufacturer_Part_Number: SMBJ22A
IC4-IC6 = TMC2209-LA-T: Integrated Circuit; Manufacturer_Name: Analog Devices; Datasheet Link: https://www.analog.com/media/en/technical-documentation/data-sheets/TMC2209_datasheet_rev1.09.pdf; Height: 0.9mm; Manufacturer_Part_Number: TMC2209-LA-T; Mouser Part Number: 700-TMC2209-LA-T; Mouser Price/Stock: https://www.mouser.co.uk/ProductDetail/ADI-Trinamic/TMC2209-LA-T?qs=TiOZkKH1s2Qz5AVGoa6OOQ%3D%3D; Arrow Part Number: TMC2209-LA-T; Arrow Price/Stock: https://www.arrow.com/en/products/tmc2209-la-t/analog-devices.html?utm_currency=USD&region=nac
R15-R20 = PE0603FRF470R22L: RES 0.22 OHM 1% 2/5W 0603